# Altium schematic sheet USB.SchDoc: USB
size A4; Author: Silvio Navaretti; CompanyName: Arduino srl; DocumentNumber: ABX00063; Revision: V1.4; SheetNumber: 3; SheetTotal: 8; RevAuthor: Silvio Navaretti
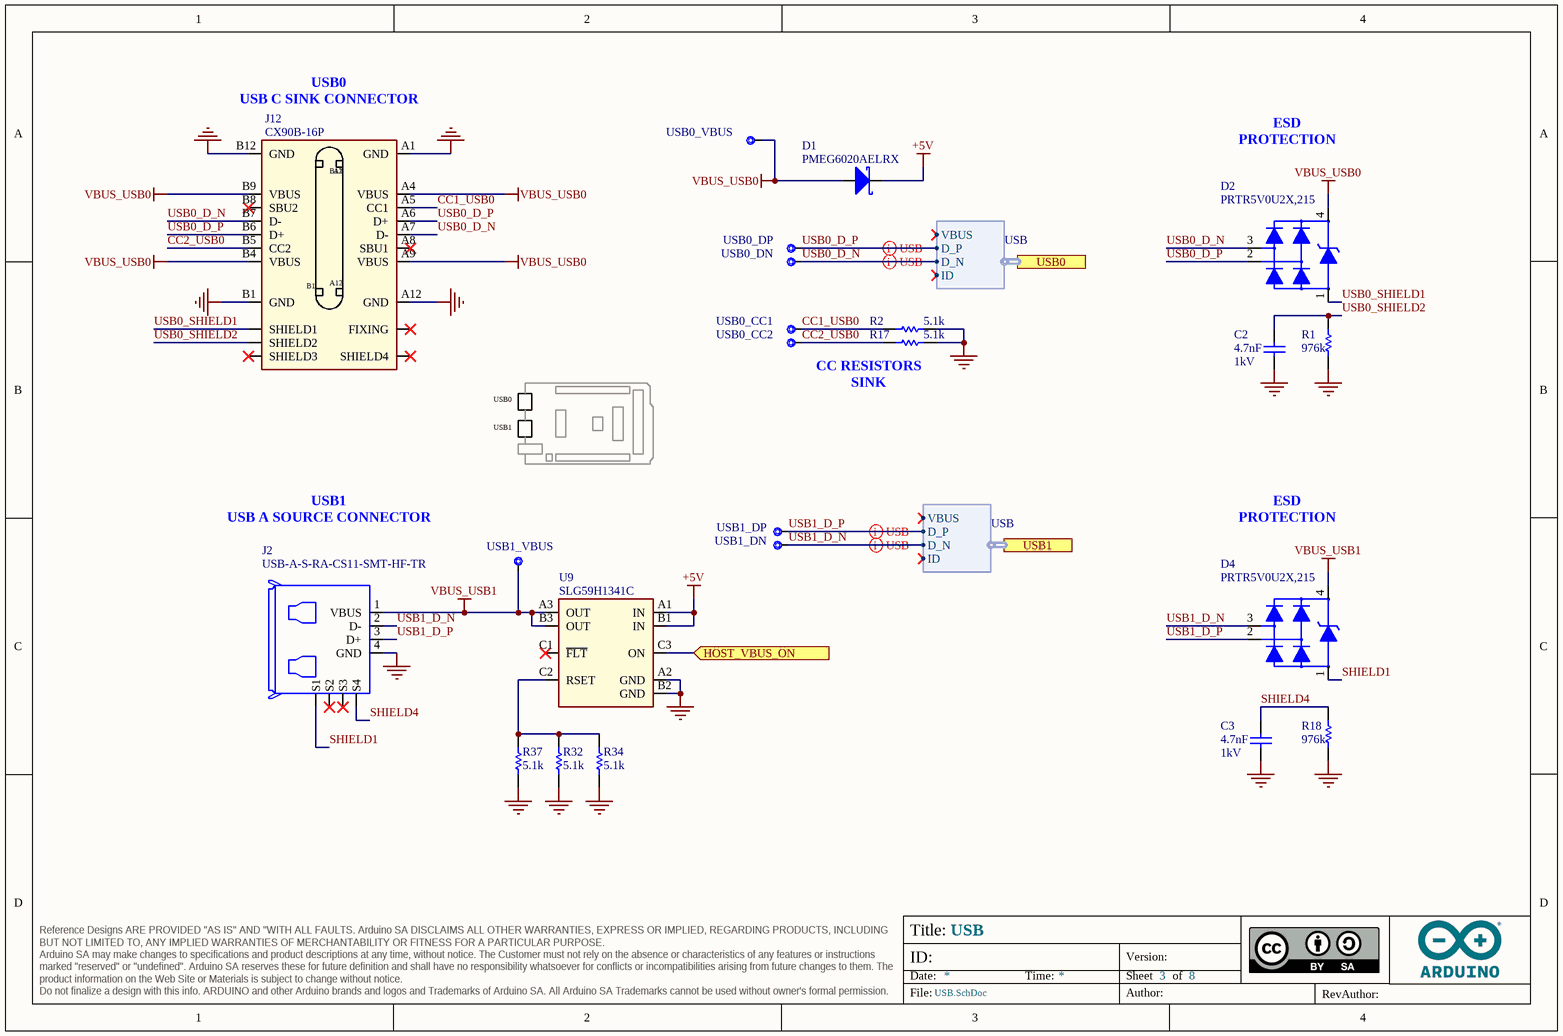
[diagram p0: USB.SchDoc]

## Parts
C2  value 4.7nF  Voltage: 1kV  [CAP-0805]  (hidden comment: FV21X472K102ECG)
C3  value 4.7nF  Voltage: 1kV  [CAP-0805]  (hidden comment: FV21X472K102ECG)
D1  PMEG6020AELRX  [SOD123-1]
D2  PRTR5V0U2X,215  [SOT190P230X110-4N]
D4  PRTR5V0U2X,215  [SOT190P230X110-4N]
J2  USB-A-S-RA-CS11-SMT-HF-TR  [USB-A-S-RA-CS11-SMT-HF-TR]
J12  CX90B-16P  [CX90B-16P-Footprint-1]
R1  value 976k  [RES-0402]  (hidden comment: CRCW0402976KFKED)
R2  value 5.1k  [RES-0402]  (hidden comment: RC0402FR-075K1L)
R17  value 5.1k  [RES-0402]  (hidden comment: RC0402FR-075K1L)
R18  value 976k  [RES-0402]  (hidden comment: CRCW0402976KFKED)
R32  value 5.1k  [RES-0402]  (hidden comment: RC0402FR-075K1L)
R34  value 5.1k  [RES-0402]  (hidden comment: RC0402FR-075K1L)
R37  value 5.1k  [RES-0402]  (hidden comment: RC0402FR-075K1L)
U9  SLG59H1341C  [BGA9C40P3X3_121X121X62]
USB0_CC1  CMP-018-0005-A.3  [TP-1.00MM]  (value not drawn)  (no BOM)
USB0_CC2  CMP-018-0005-A.3  [TP-1.00MM]  (value not drawn)  (no BOM)
USB0_DN  CMP-018-0005-A.3  [TP-1.00MM]  (value not drawn)  (no BOM)
USB0_DP  CMP-018-0005-A.3  [TP-1.00MM]  (value not drawn)  (no BOM)
USB0_VBUS  CMP-018-0005-A.3  [TP-1.00MM]  (value not drawn)  (no BOM)
USB1_DN  CMP-018-0005-A.3  [TP-1.00MM]  (value not drawn)  (no BOM)
USB1_DP  CMP-018-0005-A.3  [TP-1.00MM]  (value not drawn)  (no BOM)
USB1_VBUS  CMP-018-0005-A.3  [TP-1.00MM]  (value not drawn)  (no BOM)

## Ports
HOST_VBUS_ON (in), USB0 (harness USB), USB1 (harness USB)

## Harnesses
USB: VBUS, D_P, D_N, ID

## Nets
+5V: D1.C U9.A1(IN) U9.B1(IN)
GND: C2.1 C3.1 J2.4(GND) J12.A1(GND) J12.A12(GND) J12.B1(GND) J12.B12(GND) R1.1 R2.2 R17.2 R18.1 R32.1 R34.1 R37.1 U9.A2(GND) U9.B2(GND)
VBUS_USB0: D1.A D2.4 J12.A4(VBUS) J12.A9(VBUS) J12.B4(VBUS) J12.B9(VBUS) USB0_VBUS.X
VBUS_USB1: D4.4 J2.1(VBUS) U9.A3(OUT) U9.B3(OUT) USB1_VBUS.X
CC1_USB0: J12.A5(CC1) R2.1 USB0_CC1.X
CC2_USB0: J12.B5(CC2) R17.1 USB0_CC2.X
HOST_VBUS_ON: U9.C3(ON) ; port HOST_VBUS_ON
SHIELD1: D4.1 J2.SHIELD1(S1)
SHIELD4: C3.2 J2.SHIELD4(S4) R18.2
USB0_D_N: D2.3 J12.A7(D-) J12.B7(D-) USB0_DN.X ; port USB0.D_N
USB0_D_P: D2.2 J12.A6(D+) J12.B6(D+) USB0_DP.X ; port USB0.D_P
USB0_SHIELD1: D2.1 J12.SHIELD1
USB0_SHIELD2: C2.2 J12.SHIELD2 R1.2
USB1_D_N: D4.3 J2.2(D-) USB1_DN.X ; port USB1.D_N
USB1_D_P: D4.2 J2.3(D+) USB1_DP.X ; port USB1.D_P
NetR32_2: R32.2 R34.2 R37.2 U9.C2(RSET)

Not connected (* = marked no-connect by the designer): J2 SHIELD2(S2)* SHIELD3(S3)*; J12 A8(SBU1)* B8(SBU2)* FIXING* SHIELD3* SHIELD4*; U9 C1(~{FLT})*

## Layout directives
differential pair; differential pair class USB: USB0_D_N, USB0_D_P, USB1_D_N, USB1_D_P

## Notes on the sheet
- (near J12) USB0
  USB C SINK CONNECTOR
- ESD PROTECTION
- USB0
- USB1
- CC RESISTORS
  SINK
- USB1
  USB A SOURCE CONNECTOR
- Title:
- ID:
- Date:
- Time:
- Version:
- Sheet
- of
- RevAuthor:
- Reference Designs ARE PROVIDED "AS IS" AND "WITH ALL FAULTS. Arduino SA DISCLAIMS ALL OTHER WARRANTIES, EXPRESS OR IMPLIED, REGARDING PRODUCTS, INCLUDING BUT NOT LIMITED TO, ANY IMPLIED WARRANTIES OF MERCHANTABILITY OR FITNESS FOR A PARTICULAR PURPOSE.
  Arduino SA may make changes to specifications and product descriptions at any time, without notice. The Customer must not rely on the absence or characteristics of any features or instructions marked "reserved" or "undefined". Arduino SA reserves these for future definition and shall have no responsibility whatsoever for conflicts or incompatibilities arising from future changes to them. The product information on the Web Site or Materials is subject to change without notice.
  Do not finalize a design with this info. ARDUINO and other Arduino brands and logos and Trademarks of Arduino SA. All Arduino SA Trademarks cannot be used without owner's formal permission.
- File:
- Author:

## Library data of the parts
C2 C3 = C0059-A.14: CAP CHIP 0805 4.7nF 10% 1000V X7R; Manufacturer: PSA Shenzen; Code Arduino: 0689; Manufacturer 2: KEMET; Tolerance: 10%; Case Code (Imperial): 0805; Part Number: FV21X472K102ECG; Dielectric: X7R; Part number 2: C0805V472KDRACTU; Part number 3: C0805C472KDRACTU; Manufacturer 3: KEMET; Technology: Ceramic
D1 = D0026-A.6: DIODE SCHOTTKY SMD 2A 60V SOD123FL; Manufacturer: Nexperia; Manucturer Part Number 2: SS26L; Code Arduino: 2208; Forward Voltage: 0.6V; Manucturer 2: Hottech; RoHS Compliance: RoHS3; Part Number: PMEG6020AELRX; Device Type: Diode Schottky; Forward Current: 2A
D2 D4 = D0025-A.5: TVS ARRAY 4LIN.8kV 1pF SOT143B; Manufacturer: Nexperia; Device Type: ESD protection; Code Arduino: 2209; Part Number: PRTR5V0U2X,215
J2 = J0329-A.9: CONN USB A 2.0 FEMALE RIGHT ANGLE SMD + TH TAPE AND REEL; Manufacturer: Adam Tech; Code Arduino: J0329; Part Number: USB-A-S-RA-CS11-SMT-HF-TR
J12 = J0272-A.3: CONN RCPT USB3.1 TYPEC 16POS SMD; Manufacturer: Hirose; Code Arduino: J0272; Part Number: CX90B-16P
R1 R18 = R0070-A.24: RES CHIP 0402 976k 1% 1/16W; Manufacturer: Vishay; Power: 62.5mW; Code Arduino: R0070; Temperature coefficient: 100ppm; Case Code (Imperial): 0402; Tolerance: 1%; Part Number: CRCW0402976KFKED; Technology: Thick film
R2 R17 R32 R34 R37 = R0210-A.18: RES CHIP 0402 5k1 1% 1/16W; Manufacturer: YAGEO; Code Arduino: R0210; Power: 63mW; Temperature coefficient: 100ppm; Part Number: RC0402FR-075K1L; Case Code (Imperial): 0402; Tolerance: 1%; Technology: Thick film
U9 = U0272-A.3: IC Power switch 2.5V to 5.5V 1A reverse blocking, adj current limit, WLCSP9; Manufacturer: Renesas; Code Arduino: U0272; Part Number: SLG59H1341C
USB0_CC1 USB0_CC2 USB0_DN USB0_DP USB0_VBUS USB1_DN USB1_DP USB1_VBUS = UT0013-A.4: Test point 1.00mm; Design Item ID: CMP-018-0005-A.3; Source: ut.SchLib; Pin Count: 1